# Altium project Pukk MVP Controller Module-v1.0.PrjPcb
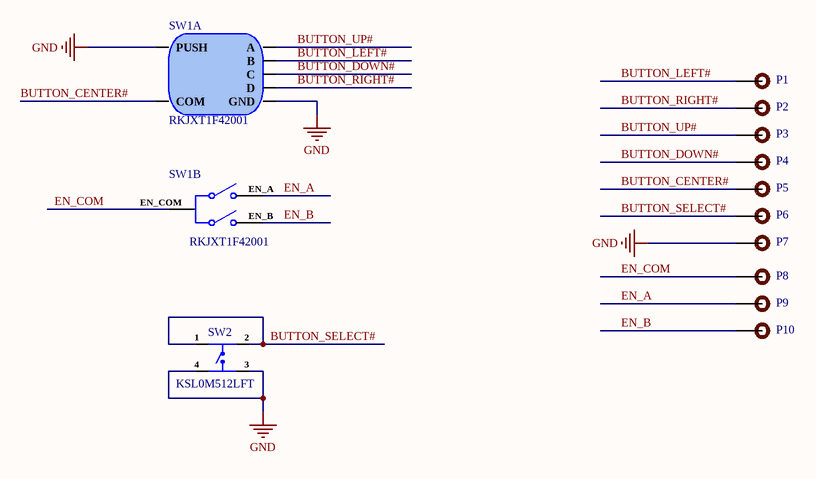
[diagram p0: Main Sheet.SchDoc]
1 sheet, 12 parts. Net scope: global (net labels, ports and power ports of the same name join across sheets).
Board file: Pukk MVP Controller_PCB-v1.0.PcbDoc

## Sheet Main Sheet.SchDoc
size A4; SheetNumber: 1; SheetTotal: 1

### Parts
P1  0.5mm Test Pad  [0.5mm Test Pad]  (value not drawn)  (no BOM)
P2  0.5mm Test Pad  [0.5mm Test Pad]  (value not drawn)  (no BOM)
P3  0.5mm Test Pad  [0.5mm Test Pad]  (value not drawn)  (no BOM)
P4  0.5mm Test Pad  [0.5mm Test Pad]  (value not drawn)  (no BOM)
P5  0.5mm Test Pad  [0.5mm Test Pad]  (value not drawn)  (no BOM)
P6  0.5mm Test Pad  [0.5mm Test Pad]  (value not drawn)  (no BOM)
P7  0.5mm Test Pad  [0.5mm Test Pad]  (value not drawn)  (no BOM)
P8  0.5mm Test Pad  [0.5mm Test Pad]  (value not drawn)  (no BOM)
P9  0.5mm Test Pad  [0.5mm Test Pad]  (value not drawn)  (no BOM)
P10  0.5mm Test Pad  [0.5mm Test Pad]  (value not drawn)  (no BOM)
SW1  RKJXT1F42001  [RKJXT1F42001]  (parts A,B of 2)
SW2  KSL0M512LFT  [KSL0M512 LFT]

### Nets
GND: P7.1 SW1.GND SW1.PUSH SW2.3 SW2.4
BUTTON_CENTER#: P5.1 SW1.COM
BUTTON_DOWN#: P4.1 SW1.C
BUTTON_LEFT#: P1.1 SW1.B
BUTTON_RIGHT#: P2.1 SW1.D
BUTTON_SELECT#: P6.1 SW2.1 SW2.2
BUTTON_UP#: P3.1 SW1.A
EN_A: P9.1 SW1.EN_A
EN_B: P10.1 SW1.EN_B
EN_COM: P8.1 SW1.EN_COM

### Notes on the sheet
- File:
- Title:
- Date:
- Page
- Num:
- Total:
- Drawn By: Huzaifa Ali

### Library data of the parts
P1-P10 = 0.5mm Test Pad: Test pad
SW1 = RKJXT1F42001: Electromechanical Switch 4-Directional Stick Switch 0.01A Bulk; Manufacturer: Alps Alpine; Manufacturer Part Number: RKJXT1F42001; Item Type: Switch; Supplier: Mouser; Supplier Part Number: 688-RKJXT1F42001; RoHS: Yes; Category: Pushbutton Switches; Stock: 1987; Pricing: 1=8.44, 10=7.1, 25=6.33, 50=6.33, 100=5.99, 250=5.75, 1000=5.75, 10000=5.75 (USD); ComponentLink1URL: https://datasheet.ciiva.com/16197/rkjxt-16197381.pdf?src-supplier=Onlinecomponents.com; ComponentLink1Description: https://datasheet.ciiva.com/16197/rkjxt-16197381.pdf?src-supplier=Onlinecomponents.com
SW2 = KSL0M512LFT: SWITCH TACTILE SPST-NO 0.05A 32V; Manufacturer: ITT C&K; Item Type: Tactile Switches; Supplier: Digikey; Supplier Part Number: 401-1837-ND; Manufacturer Part Number: KSL0M512LFT; RoHS: Yes; Stock: 9888; Pricing: 1=0.84, 10=0.718, 25=0.6684, 100=0.5961, 250=0.55216, 500=0.52152, 1000=0.49338, 2500=0.46016, 5000=0.43804 (USD); ComponentLink1URL: https://datasheet.ciiva.com/2901/ksa-ksl-mkii-2901962.pdf?src-supplier=Digikey; ComponentLink1Description: https://datasheet.ciiva.com/2901/ksa-ksl-mkii-2901962.pdf?src-supplier=Digikey